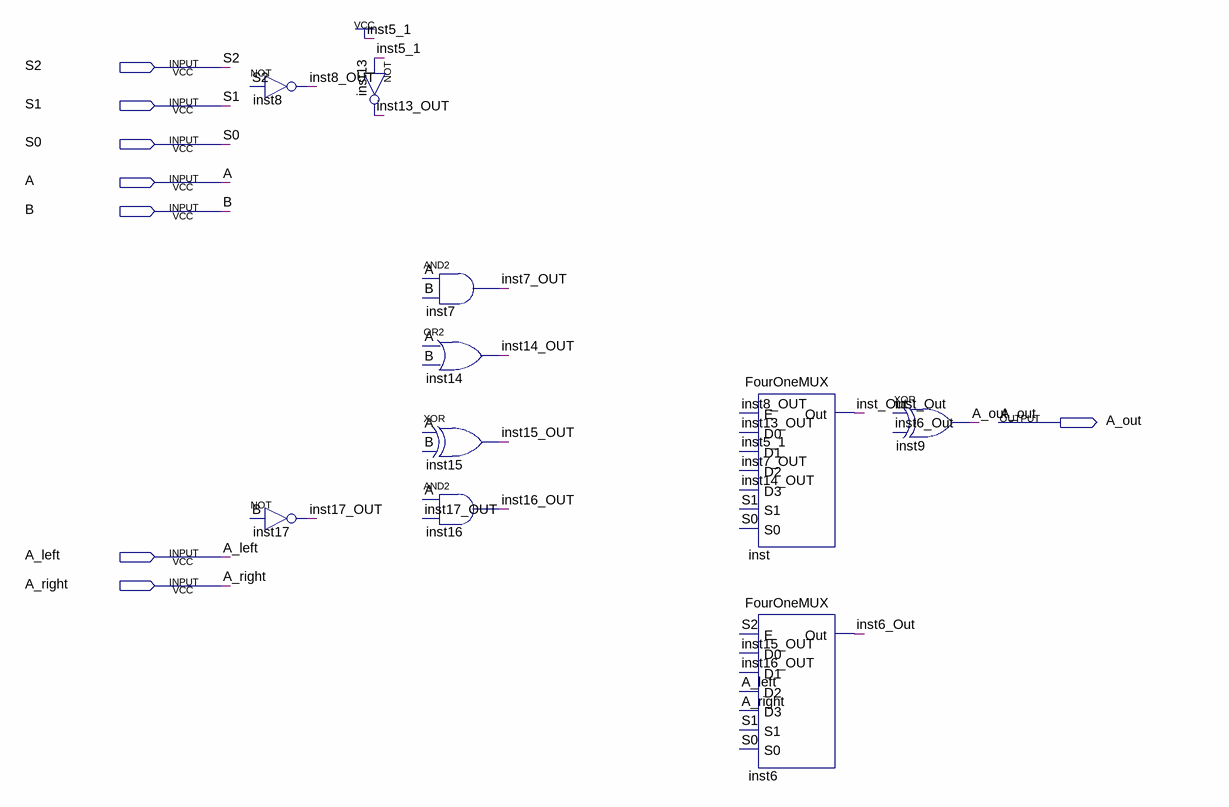
[diagram p0: schematic sheet]
// Quartus schematic 1bitLogicCircuit.bdf as structural Verilog: 10 symbols, 8 pins
module \1bitLogicCircuit  (
  input  S2,
  input  S1,
  input  S0,
  input  A,
  input  B,
  input  A_left,
  input  A_right,
  output A_out
);

  wire inst6_Out, inst7_OUT, inst8_OUT, inst13_OUT, inst14_OUT, inst15_OUT, inst16_OUT, inst17_OUT, inst_Out;

  not inst8 (inst8_OUT, S2);
  not inst17 (inst17_OUT, B);
  not inst13 (inst13_OUT, 1'b1);
  and inst7 (inst7_OUT, A, B);
  or inst14 (inst14_OUT, A, B);
  xor inst15 (inst15_OUT, A, B);
  and inst16 (inst16_OUT, A, inst17_OUT);
  FourOneMUX inst (
    .E(inst8_OUT), .D0(inst13_OUT), .D1(1'b1), .D2(inst7_OUT), .D3(inst14_OUT), .S1(S1), .S0(S0),
    .Out(inst_Out));
  FourOneMUX inst6 (
    .E(S2), .D0(inst15_OUT), .D1(inst16_OUT), .D2(A_left), .D3(A_right), .S1(S1), .S0(S0), .Out(inst6_Out));
  xor inst9 (A_out, inst_Out, inst6_Out);
endmodule
